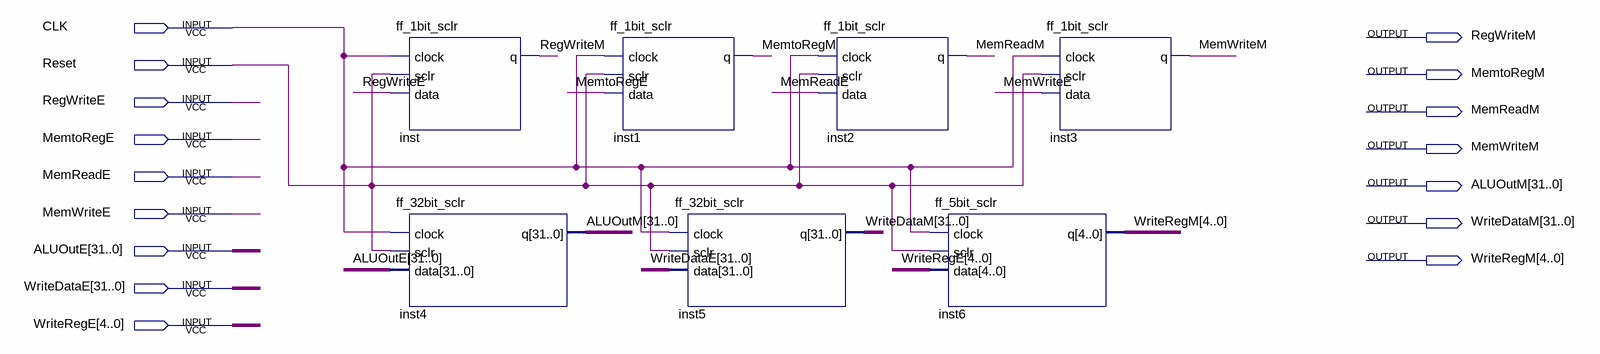
[diagram p0: schematic sheet]
// Quartus schematic EX_MEM_Reg.bdf as structural Verilog: 7 symbols, 16 pins
module EX_MEM_Reg (
  input  CLK,
  input  Reset,
  input  RegWriteE,
  input  MemtoRegE,
  input  MemReadE,
  input  MemWriteE,
  input  [31:0] ALUOutE,
  input  [31:0] WriteDataE,
  input  [4:0] WriteRegE,
  output RegWriteM,
  output MemtoRegM,
  output MemReadM,
  output MemWriteM,
  output [31:0] ALUOutM,
  output [31:0] WriteDataM,
  output [4:0] WriteRegM
);

  ff_1bit_sclr inst (.clock(CLK), .sclr(Reset), .data(RegWriteE), .q(RegWriteM));
  ff_32bit_sclr inst4 (.clock(CLK), .sclr(Reset), .data(ALUOutE), .q(ALUOutM));
  ff_1bit_sclr inst1 (.clock(CLK), .sclr(Reset), .data(MemtoRegE), .q(MemtoRegM));
  ff_32bit_sclr inst5 (.clock(CLK), .sclr(Reset), .data(WriteDataE), .q(WriteDataM));
  ff_1bit_sclr inst2 (.clock(CLK), .sclr(Reset), .data(MemReadE), .q(MemReadM));
  ff_5bit_sclr inst6 (.clock(CLK), .sclr(Reset), .data(WriteRegE), .q(WriteRegM));
  ff_1bit_sclr inst3 (.clock(CLK), .sclr(Reset), .data(MemWriteE), .q(MemWriteM));
endmodule
